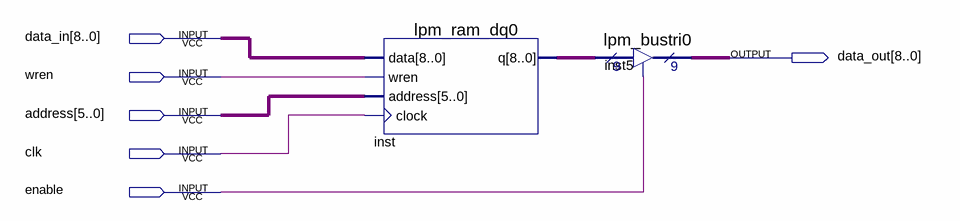
[diagram p0: schematic sheet]
// Quartus schematic ram.bdf as structural Verilog: 2 symbols, 6 pins
module ram (
  input  [8:0] data_in,
  input  wren,
  input  [5:0] address,
  input  clk,
  input  enable,
  output [8:0] data_out
);

  wire [8:0] inst_q;

  lpm_ram_dq0 inst (.data(data_in), .wren(wren), .address(address), .clock(clk), .q(inst_q));
  lpm_bustri0 inst5 (.enabledt(enable), .data(inst_q), .tridata(data_out));
endmodule
